# Altium schematic sheet TimerDesign.SchDoc
size A4
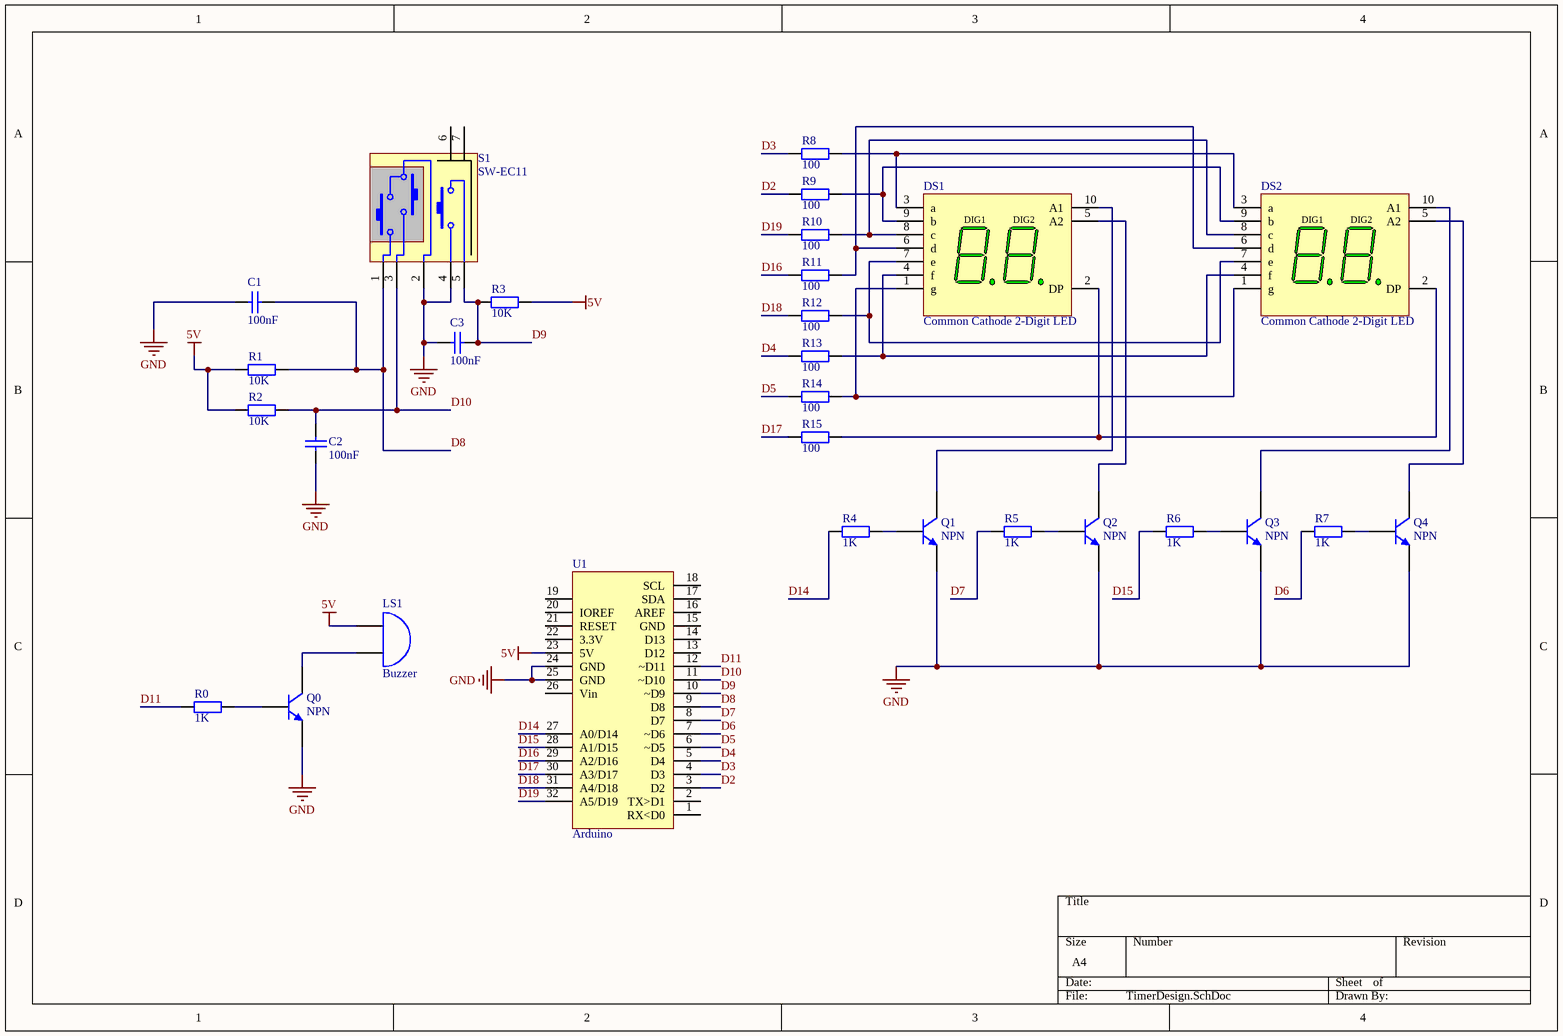
[diagram p0: TimerDesign.SchDoc]

## Parts
C1  100nF  [RAD0.2]
C2  100nF  [RAD0.2]
C3  100nF  [RAD0.2]
DS1  Common Cathode 2-Digit LED  [HDSM-577]
DS2  Common Cathode 2-Digit LED  [HDSM-577]
LS1  Buzzer  [SIP-2]
Q0  NPN  [NPN]
Q1  NPN  [NPN]
Q2  NPN  [NPN]
Q3  NPN  [NPN]
Q4  NPN  [NPN]
R0  1K  [AXIAL-0.4]
R1  10K  [AXIAL-0.4]
R2  10K  [AXIAL-0.4]
R3  10K  [AXIAL-0.4]
R4  1K  [AXIAL-0.4]
R5  1K  [AXIAL-0.4]
R6  1K  [AXIAL-0.4]
R7  1K  [AXIAL-0.4]
R8  100  [AXIAL-0.4]
R9  100  [AXIAL-0.4]
R10  100  [AXIAL-0.4]
R11  100  [AXIAL-0.4]
R12  100  [AXIAL-0.4]
R13  100  [AXIAL-0.4]
R14  100  [AXIAL-0.4]
R15  100  [AXIAL-0.4]
S1  SW-EC11  [EC11]
U1  Arduino  [Arduino-UNO-EX]

## Nets
5V: LS1.1(A) R1.2 R2.2 R3.2 U1.23(5V)
GND: C1.2 C2.2 C3.2 Q0.1(E) Q1.1(E) Q2.1(E) Q3.1(E) Q4.1(E) S1.2 S1.4 U1.24(GND) U1.25(GND)
D2: R9.1 U1.3(D2)
D3: R8.1 U1.4(D3)
D4: R13.1 U1.5(D4)
D5: R14.1 U1.6(~D5)
D6: R7.1 U1.7(~D6)
D7: R5.1 U1.8(D7)
D8: C1.1 R1.1 S1.1 U1.9(D8)
D9: C3.1 R3.1 S1.5 U1.10(~D9)
D10: C2.1 R2.1 S1.3 U1.11(~D10)
D11: R0.1 U1.12(~D11)
D14: R4.1 U1.27(A0/D14)
D15: R6.1 U1.28(A1/D15)
D16: R11.1 U1.29(A2/D16)
D17: R15.1 U1.30(A3/D17)
D18: R12.1 U1.31(A4/D18)
D19: R10.1 U1.32(A5/D19)
NetDS1_1: DS1.1(g) DS2.1(g) R14.2
NetDS1_2: DS1.2(DP) DS2.2(DP) R15.2
NetDS1_3: DS1.3(a) DS2.3(a) R8.2
NetDS1_4: DS1.4(f) DS2.4(f) R13.2
NetDS1_5: DS1.5(A2) Q2.3(C)
NetDS1_6: DS1.6(d) DS2.6(d) R11.2
NetDS1_7: DS1.7(e) DS2.7(e) R12.2
NetDS1_8: DS1.8(c) DS2.8(c) R10.2
NetDS1_9: DS1.9(b) DS2.9(b) R9.2
NetDS1_10: DS1.10(A1) Q1.3(C)
NetDS2_5: DS2.5(A2) Q4.3(C)
NetDS2_10: DS2.10(A1) Q3.3(C)
NetLS1_2: LS1.2(B) Q0.3(C)
NetQ0_2: Q0.2(B) R0.2
NetQ1_2: Q1.2(B) R4.2
NetQ2_2: Q2.2(B) R5.2
NetQ3_2: Q3.2(B) R6.2
NetQ4_2: Q4.2(B) R7.2

Not connected (* = marked no-connect by the designer): S1 6 7; U1 1(RX<D0) 2(TX>D1) 13(D12) 14(D13) 15(GND) 16(AREF) 17(SDA) 18(SCL) 19 20(IOREF) 21(RESET) 22(3.3V) 26(Vin)

## Notes on the sheet
- (in symbol HDSM-577G) DIG1; DIG2

## Library data of the parts
C1-C3 = Cap: Capacitor; Published: 8-Jun-2000; LatestRevisionDate: 17-Jul-2002; LatestRevisionNote: Re-released for DXP Platform.; PackageReference: RAD-0.3; Publisher: Altium Limited; Value: 100nF
DS1 DS2 = HDSM-577G: 9.2 mm Green 7-Segment Display: 2-Digit, RH DP; LuminousIntensity: 1100 ucd (Minimum).; Published: 26-May-2004; LatestRevisionDate: 11-Oct-2004; LatestRevisionNote: Display outline superimposed on PCB Footprint.; DatasheetDocument: 14-Mar-2003; PackageDocument: 14-Mar-2003; PackageReference: HDSM-577; Publisher: Altium Limited; LED_Colour: Green; ComponentLink1Description: Manufacturer Link; ComponentLink1URL: http://www.agilent.com/
LS1 = Bell: Electrical Bell; Published: 24-Mar-1999; LatestRevisionDate: 17-Jul-2002; LatestRevisionNote: Re-released for DXP Platform.; PackageReference: PIN2; Publisher: Altium Limited
Q0-Q4 = NPN: NPN Bipolar Transistor; Published: 8-Jun-2000; LatestRevisionDate: 17-Jul-2002; LatestRevisionNote: Re-released for DXP Platform.; PackageReference: TO-226; Publisher: Altium Limited; Code_JEDEC: TO-226-AA
R0-R15 = Res2: Resistor; Published: 8-Jun-2000; LatestRevisionDate: 17-Jul-2002; LatestRevisionNote: Re-released for DXP Platform.; PackageReference: AXIAL-0.4; Publisher: Altium Limited
  R0 R4-R7: Value: 1K
  R1-R3: Value: 10K
  R8-R15: Value: 100
S1 = SW-EC11: 旋转编码开关; Published: 24-Mar-1999; LatestRevisionDate: 17-Jul-2002; LatestRevisionNote: Re-released for DXP Platform.; PackageReference: SPST-2; Publisher: Altium Limited
U1 = Arduino-UNO-EX